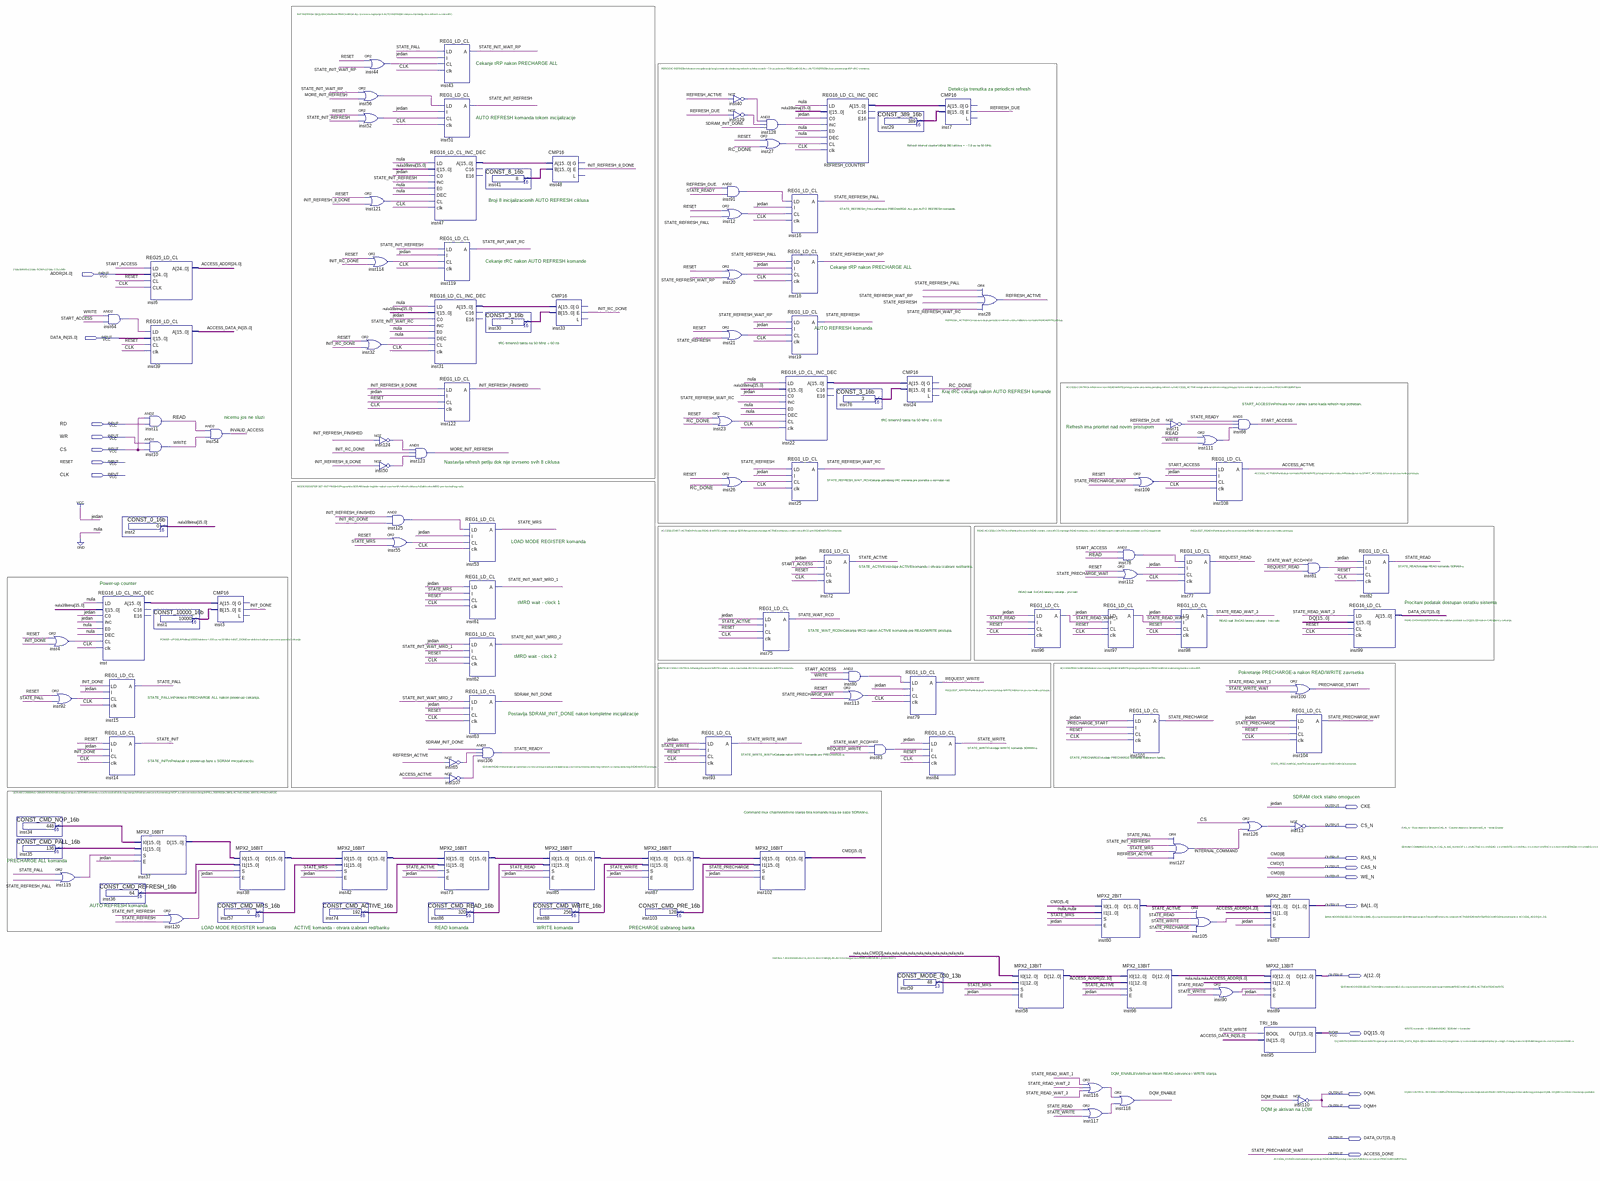
[diagram p0: schematic sheet, whole]
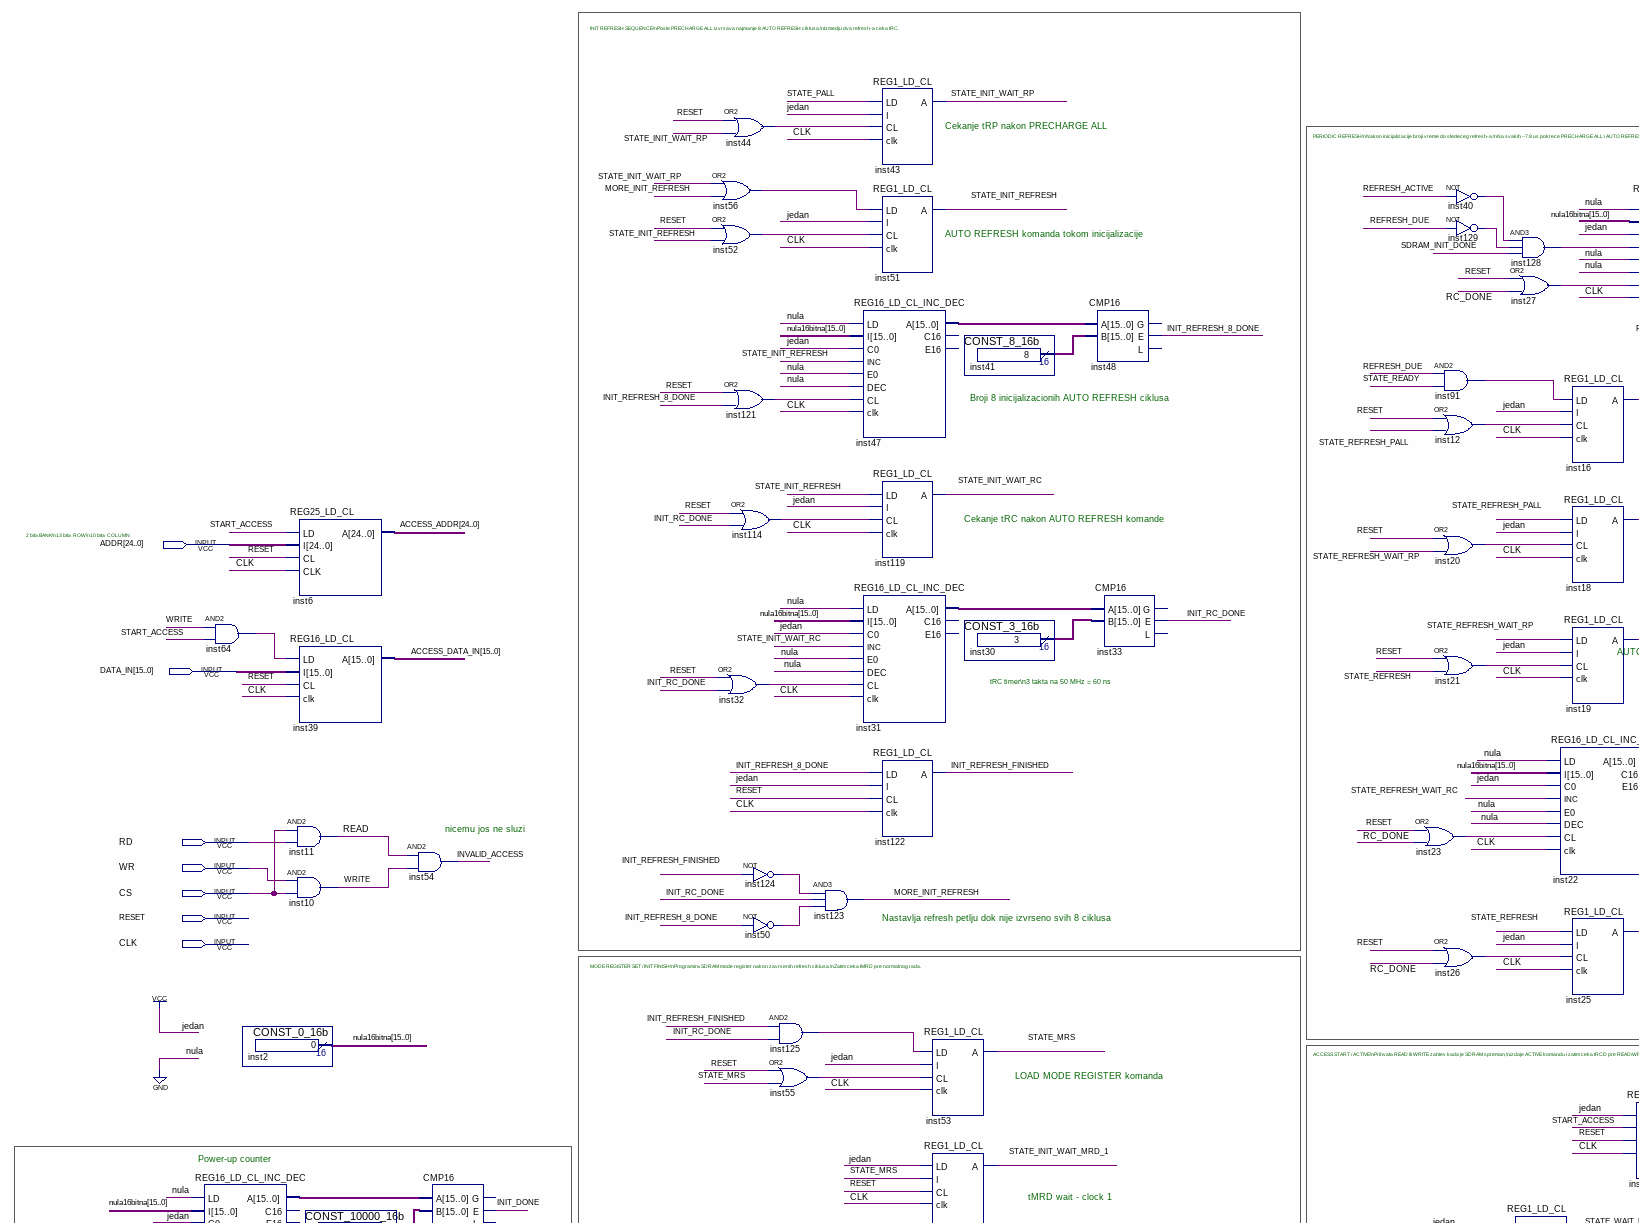
[diagram p1: schematic sheet, upper left part]
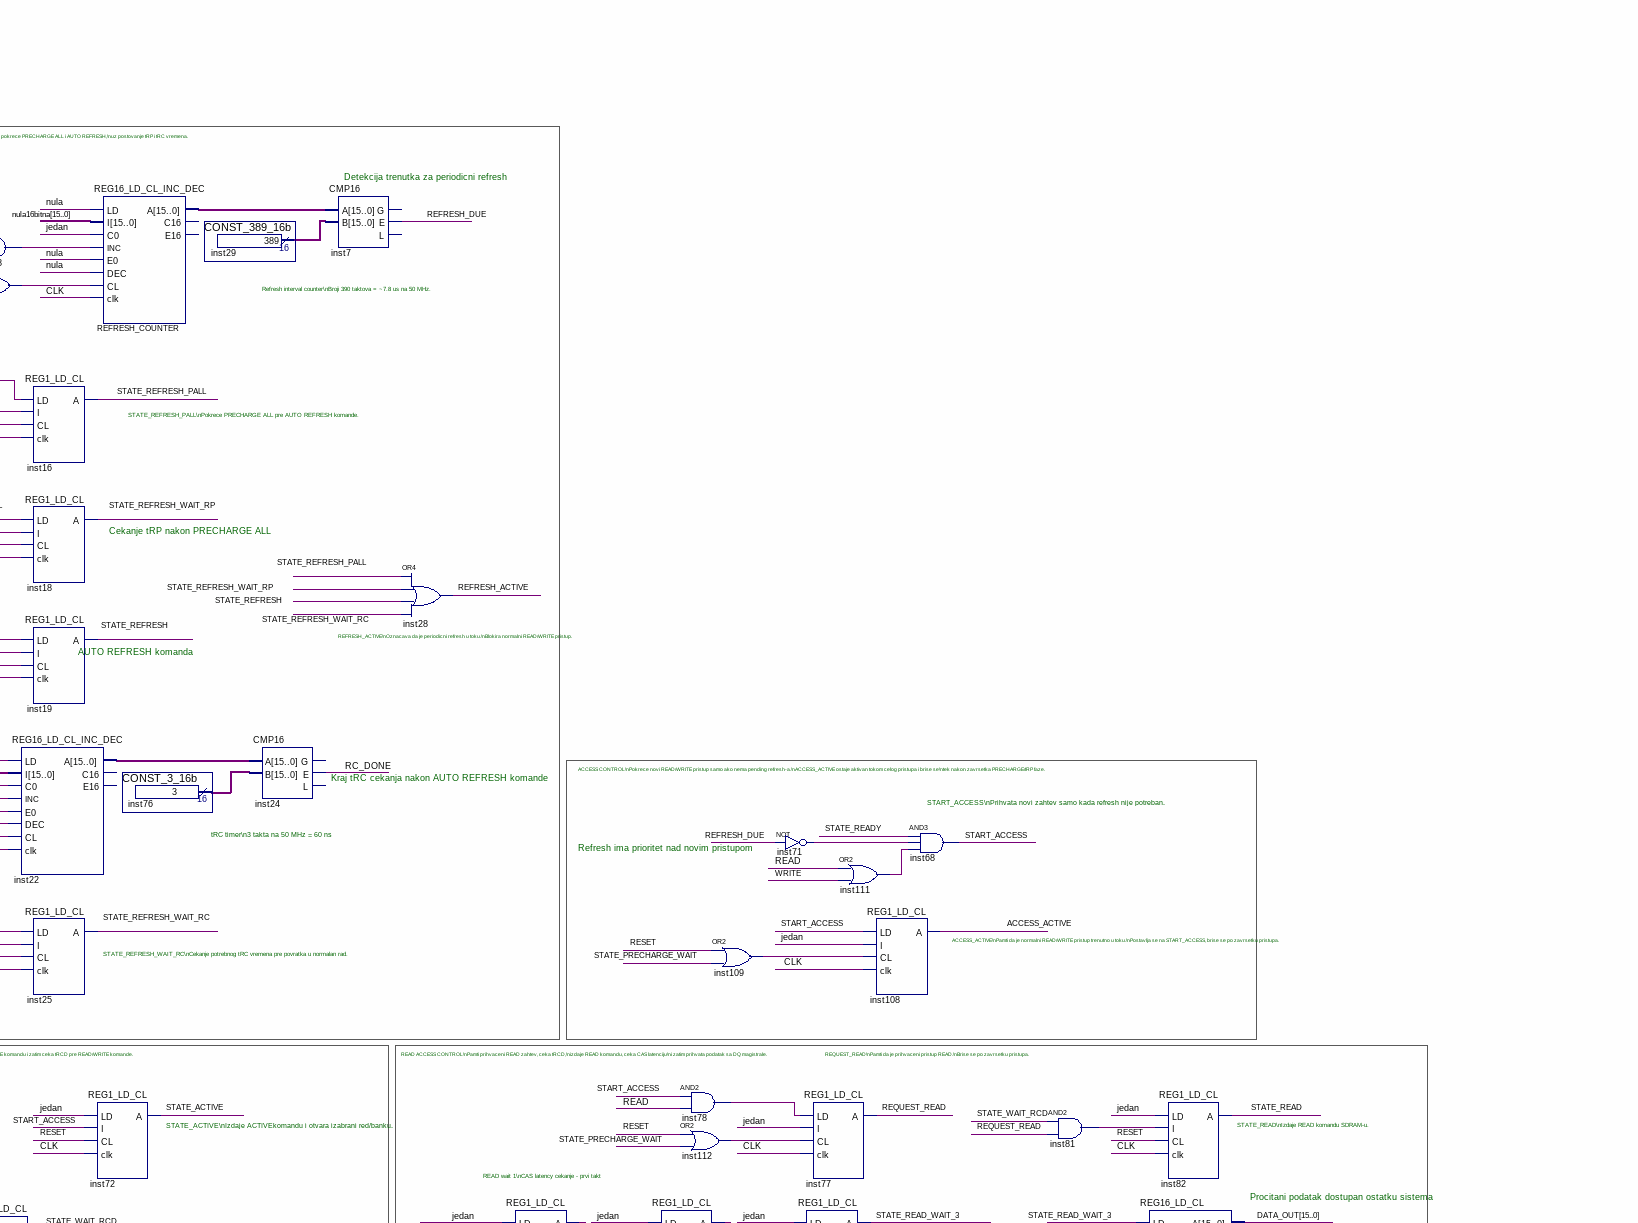
[diagram p2: schematic sheet, upper right part]
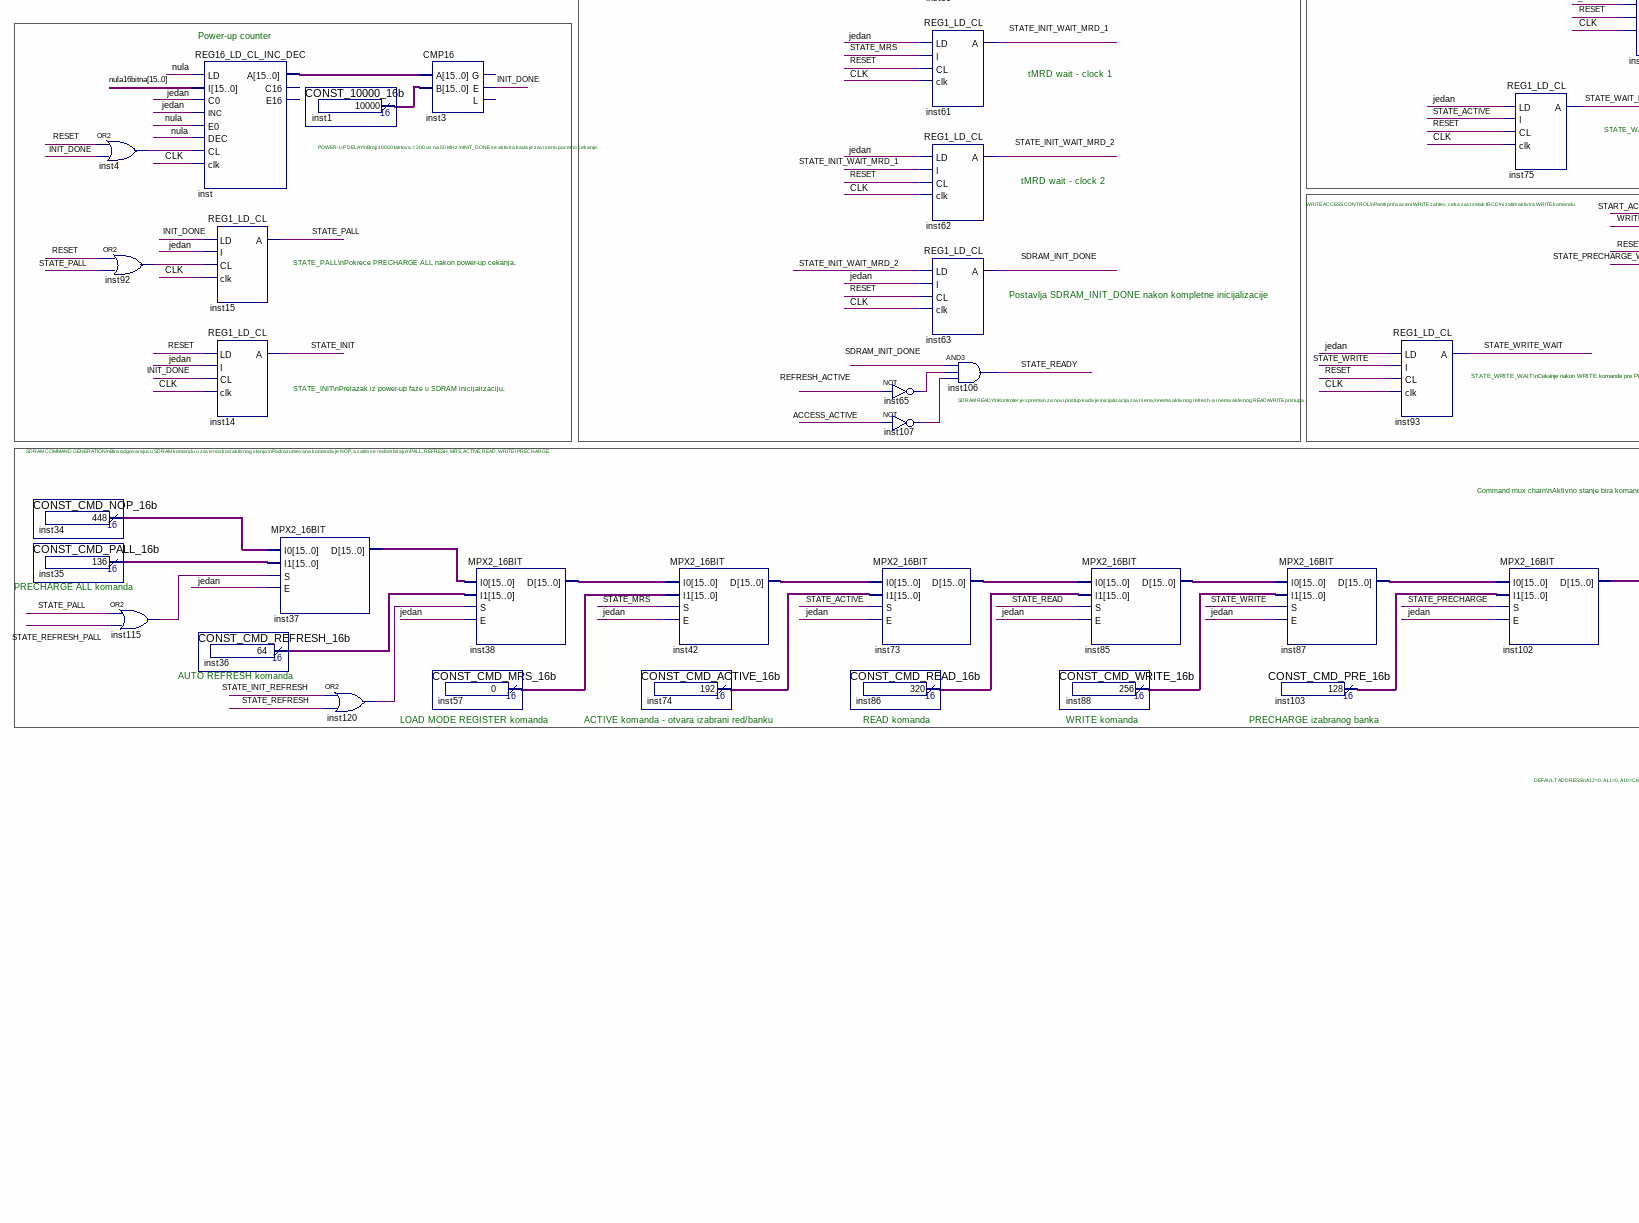
[diagram p3: schematic sheet, lower left part]
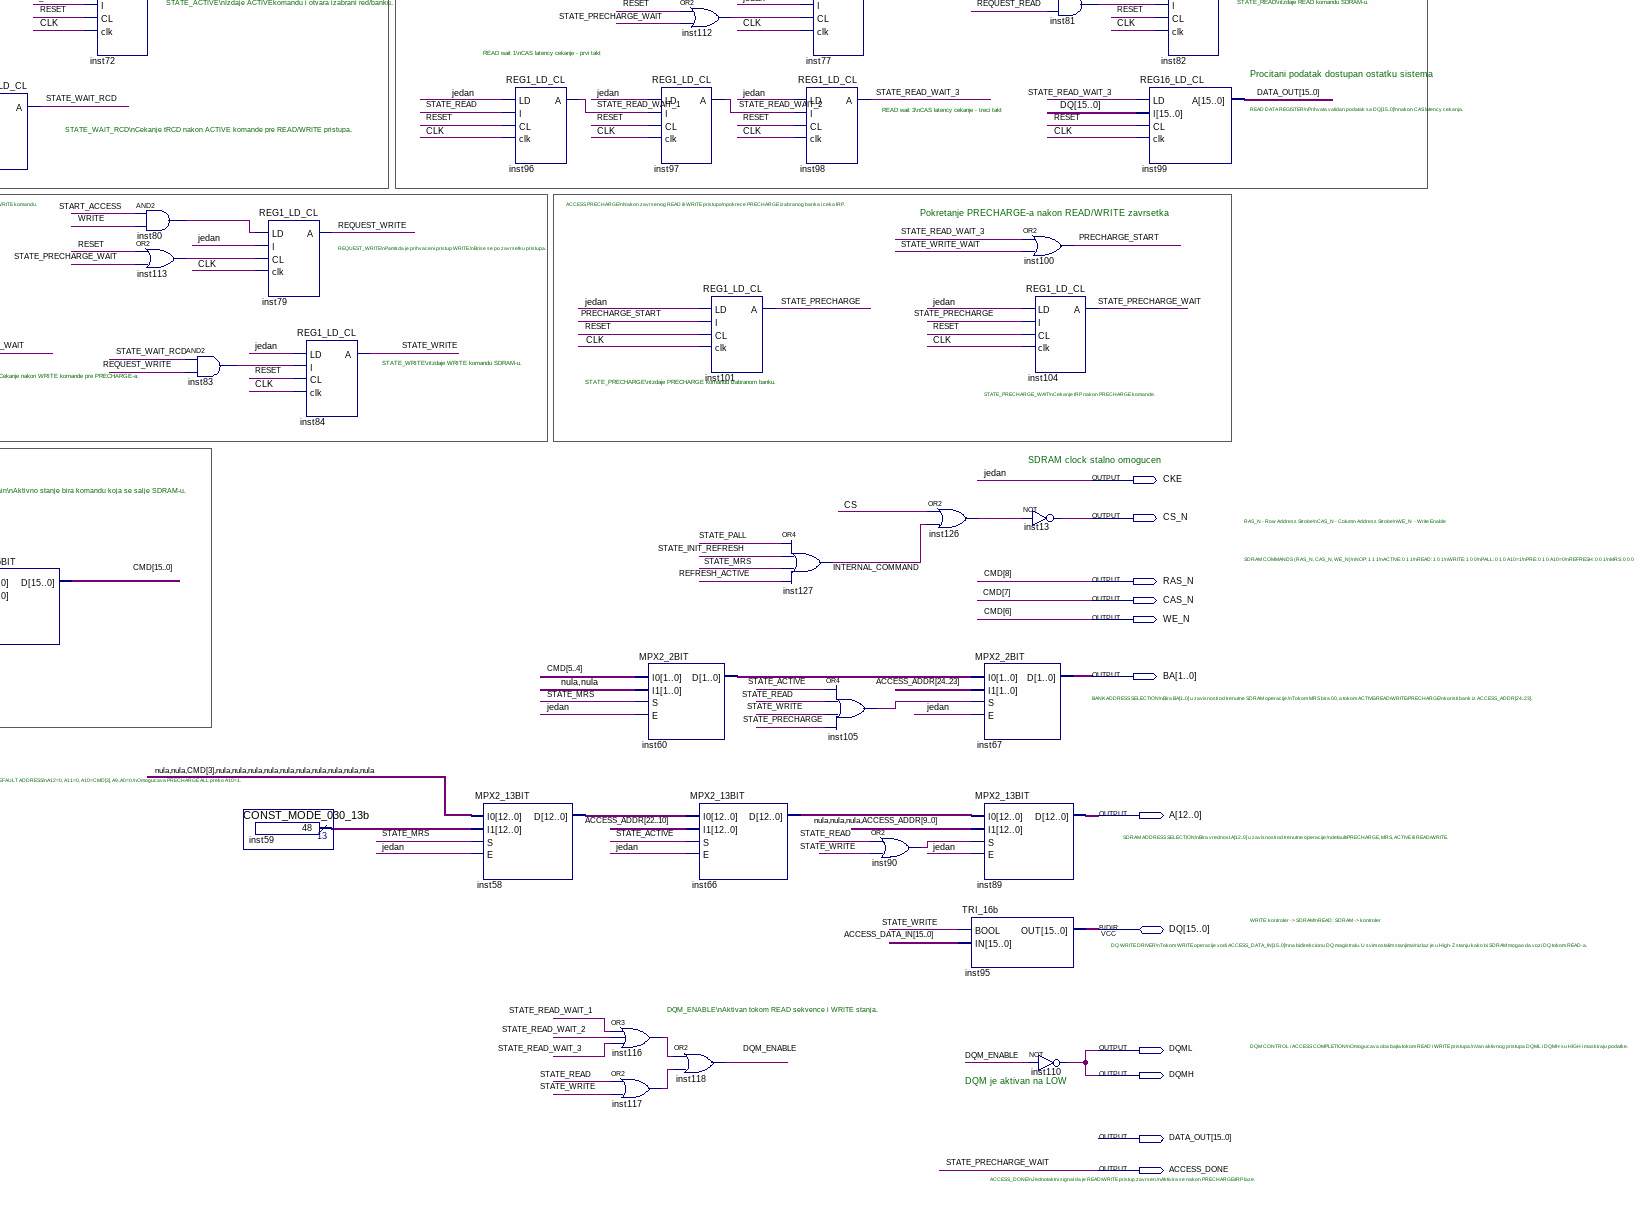
[diagram p4: schematic sheet, lower right part]
// Quartus schematic sdram_controller.bdf as structural Verilog: 121 symbols, 19 pins
module sdram_controller (
  input  [24:0] ADDR,
  input  [15:0] DATA_IN,
  input  RD,
  input  WR,
  input  CS,
  input  RESET,
  input  CLK,
  inout  [15:0] DQ,
  output CKE,
  output CS_N,
  output RAS_N,
  output CAS_N,
  output WE_N,
  output [1:0] BA,
  output [12:0] A,
  output DQML,
  output DQMH,
  output [15:0] DATA_OUT,
  output ACCESS_DONE
);

  wire ACCESS_ACTIVE, DQM_ENABLE, INIT_DONE, INIT_RC_DONE, INIT_REFRESH_8_DONE, INIT_REFRESH_FINISHED,
       inst4_out, inst12_out, inst20_out, inst21_out, inst23_out, inst26_out, inst27_out, inst32_out,
       inst40_out, inst44_out, inst50_out, inst52_out, inst55_out, inst56_out, inst64_out, inst65_out,
       inst71_out, inst78_out, inst80_out, inst81_out, inst83_out, inst90_out, inst91_out, inst92_out,
       inst105_out, inst107_out, inst109_out, inst111_out, inst112_out, inst113_out, inst114_out,
       inst115_out, inst116_out, inst117_out, inst120_out, inst121_out, inst124_out, inst125_out,
       inst126_out, inst128_out, inst129_out, INTERNAL_COMMAND, INVALID_ACCESS, MORE_INIT_REFRESH,
       PRECHARGE_START, RC_DONE, READ, REFRESH_ACTIVE, REFRESH_DUE, REQUEST_READ, REQUEST_WRITE,
       SDRAM_INIT_DONE, START_ACCESS, STATE_ACTIVE, STATE_INIT, STATE_INIT_REFRESH, STATE_INIT_WAIT_MRD_1,
       STATE_INIT_WAIT_MRD_2, STATE_INIT_WAIT_RC, STATE_INIT_WAIT_RP, STATE_MRS, STATE_PALL, STATE_PRECHARGE,
       STATE_READ, STATE_READ_WAIT_1, STATE_READ_WAIT_2, STATE_READ_WAIT_3, STATE_READY, STATE_REFRESH,
       STATE_REFRESH_PALL, STATE_REFRESH_WAIT_RC, STATE_REFRESH_WAIT_RP, STATE_WAIT_RCD, STATE_WRITE,
       STATE_WRITE_WAIT, WRITE;
  wire [1:0] inst60_d;
  wire [12:0] inst58_d, inst59_result, inst66_d;
  wire [15:0] ACCESS_DATA_IN, CMD, inst1_result, inst22_a, inst29_result, inst30_result, inst31_a,
       inst34_result, inst35_result, inst36_result, inst37_d, inst38_d, inst41_result, inst42_d, inst47_a,
       inst57_result, inst73_d, inst74_result, inst76_result, inst85_d, inst86_result, inst87_d,
       inst88_result, inst103_result, inst_a, nula16bitna, REFRESH_COUNTER_a;
  wire [24:0] ACCESS_ADDR;

  CONST_CMD_NOP_16b inst34 (.result(inst34_result));
  CONST_CMD_PALL_16b inst35 (.result(inst35_result));
  or inst4 (inst4_out, RESET, INIT_DONE);
  or inst92 (inst92_out, RESET, STATE_PALL);
  or inst115 (inst115_out, STATE_PALL, STATE_REFRESH_PALL);
  and inst64 (inst64_out, WRITE, START_ACCESS);
  REG16_LD_CL_INC_DEC inst (
    .LD(1'b0), .I(nula16bitna), .C0(1'b1), .INC(1'b1), .E0(1'b0), .DEC(1'b0), .CL(inst4_out), .clk(CLK),
    .A(inst_a));  // open: C16, E16
  REG1_LD_CL inst15 (.LD(INIT_DONE), .I(1'b1), .CL(inst92_out), .clk(CLK), .A(STATE_PALL));
  REG1_LD_CL inst14 (.LD(RESET), .I(1'b1), .CL(INIT_DONE), .clk(CLK), .A(STATE_INIT));
  CONST_CMD_REFRESH_16b inst36 (.result(inst36_result));
  CONST_0_16b inst2 (.result(nula16bitna));
  MPX2_16BIT inst37 (.I0(inst34_result), .I1(inst35_result), .S(inst115_out), .E(1'b1), .D(inst37_d));
  REG25_LD_CL inst6 (.LD(START_ACCESS), .I(ADDR), .CL(RESET), .CLK(CLK), .A(ACCESS_ADDR));
  REG16_LD_CL inst39 (.LD(inst64_out), .I(DATA_IN), .CL(RESET), .clk(CLK), .A(ACCESS_DATA_IN));
  and inst11 (READ, CS, RD);
  and inst10 (WRITE, WR, CS);
  CONST_10000_16b inst1 (.result(inst1_result));
  or inst120 (inst120_out, STATE_INIT_REFRESH, STATE_REFRESH);
  and inst54 (INVALID_ACCESS, READ, WRITE);
  CMP16 inst3 (.A(inst_a), .B(inst1_result), .E(INIT_DONE));  // open: G, L
  CONST_CMD_MRS_16b inst57 (.result(inst57_result));
  MPX2_16BIT inst38 (.I0(inst37_d), .I1(inst36_result), .S(inst120_out), .E(1'b1), .D(inst38_d));
  MPX2_16BIT inst42 (.I0(inst38_d), .I1(inst57_result), .S(STATE_MRS), .E(1'b1), .D(inst42_d));
  CONST_CMD_ACTIVE_16b inst74 (.result(inst74_result));
  or inst44 (inst44_out, RESET, STATE_INIT_WAIT_RP);
  or inst56 (inst56_out, STATE_INIT_WAIT_RP, MORE_INIT_REFRESH);
  or inst52 (inst52_out, RESET, STATE_INIT_REFRESH);
  or inst121 (inst121_out, RESET, INIT_REFRESH_8_DONE);
  or inst114 (inst114_out, RESET, INIT_RC_DONE);
  or inst32 (inst32_out, RESET, INIT_RC_DONE);
  not inst124 (inst124_out, INIT_REFRESH_FINISHED);
  not inst50 (inst50_out, INIT_REFRESH_8_DONE);
  and inst125 (inst125_out, INIT_REFRESH_FINISHED, INIT_RC_DONE);
  or inst55 (inst55_out, RESET, STATE_MRS);
  and inst123 (MORE_INIT_REFRESH, inst124_out, INIT_RC_DONE, inst50_out);
  REG1_LD_CL inst43 (.LD(STATE_PALL), .I(1'b1), .CL(inst44_out), .clk(CLK), .A(STATE_INIT_WAIT_RP));
  REG1_LD_CL inst51 (.LD(inst56_out), .I(1'b1), .CL(inst52_out), .clk(CLK), .A(STATE_INIT_REFRESH));
  REG16_LD_CL_INC_DEC inst47 (
    .LD(1'b0), .I(nula16bitna), .C0(1'b1), .INC(STATE_INIT_REFRESH), .E0(1'b0), .DEC(1'b0), .CL(inst121_out),
    .clk(CLK), .A(inst47_a));  // open: C16, E16
  REG1_LD_CL inst119 (.LD(STATE_INIT_REFRESH), .I(1'b1), .CL(inst114_out), .clk(CLK), .A(STATE_INIT_WAIT_RC));
  REG16_LD_CL_INC_DEC inst31 (
    .LD(1'b0), .I(nula16bitna), .C0(1'b1), .INC(STATE_INIT_WAIT_RC), .E0(1'b0), .DEC(1'b0), .CL(inst32_out),
    .clk(CLK), .A(inst31_a));  // open: C16, E16
  REG1_LD_CL inst122 (.LD(INIT_REFRESH_8_DONE), .I(1'b1), .CL(RESET), .clk(CLK), .A(INIT_REFRESH_FINISHED));
  not inst65 (inst65_out, REFRESH_ACTIVE);
  not inst107 (inst107_out, ACCESS_ACTIVE);
  MPX2_16BIT inst73 (.I0(inst42_d), .I1(inst74_result), .S(STATE_ACTIVE), .E(1'b1), .D(inst73_d));
  CONST_CMD_READ_16b inst86 (.result(inst86_result));
  REG1_LD_CL inst53 (.LD(inst125_out), .I(1'b1), .CL(inst55_out), .clk(CLK), .A(STATE_MRS));
  REG1_LD_CL inst61 (.LD(1'b1), .I(STATE_MRS), .CL(RESET), .clk(CLK), .A(STATE_INIT_WAIT_MRD_1));
  REG1_LD_CL inst62 (.LD(1'b1), .I(STATE_INIT_WAIT_MRD_1), .CL(RESET), .clk(CLK), .A(STATE_INIT_WAIT_MRD_2));
  REG1_LD_CL inst63 (.LD(STATE_INIT_WAIT_MRD_2), .I(1'b1), .CL(RESET), .clk(CLK), .A(SDRAM_INIT_DONE));
  CONST_8_16b inst41 (.result(inst41_result));
  CONST_3_16b inst30 (.result(inst30_result));
  and inst106 (STATE_READY, SDRAM_INIT_DONE, inst65_out, inst107_out);
  CMP16 inst48 (.A(inst47_a), .B(inst41_result), .E(INIT_REFRESH_8_DONE));  // open: G, L
  CMP16 inst33 (.A(inst31_a), .B(inst30_result), .E(INIT_RC_DONE));  // open: G, L
  MPX2_16BIT inst85 (.I0(inst73_d), .I1(inst86_result), .S(STATE_READ), .E(1'b1), .D(inst85_d));
  CONST_CMD_WRITE_16b inst88 (.result(inst88_result));
  MPX2_16BIT inst87 (.I0(inst85_d), .I1(inst88_result), .S(STATE_WRITE), .E(1'b1), .D(inst87_d));
  CONST_CMD_PRE_16b inst103 (.result(inst103_result));
  REG1_LD_CL inst93 (.LD(1'b1), .I(STATE_WRITE), .CL(RESET), .clk(CLK), .A(STATE_WRITE_WAIT));
  not inst40 (inst40_out, REFRESH_ACTIVE);
  not inst129 (inst129_out, REFRESH_DUE);
  and inst91 (inst91_out, REFRESH_DUE, STATE_READY);
  or inst12 (inst12_out, RESET, STATE_REFRESH_PALL);
  or inst20 (inst20_out, RESET, STATE_REFRESH_WAIT_RP);
  or inst21 (inst21_out, RESET, STATE_REFRESH);
  or inst23 (inst23_out, RESET, RC_DONE);
  or inst26 (inst26_out, RESET, RC_DONE);
  MPX2_16BIT inst102 (
    .I0(inst87_d), .I1(inst103_result), .S(STATE_PRECHARGE), .E(1'b1),
    .D({CMD[15:9], RAS_N, CAS_N, WE_N, CMD[5:0]}));
  and inst128 (inst128_out, inst40_out, inst129_out, SDRAM_INIT_DONE);
  or inst27 (inst27_out, RESET, RC_DONE);
  REG16_LD_CL_INC_DEC inst22 (
    .LD(1'b0), .I(nula16bitna), .C0(1'b1), .INC(STATE_REFRESH_WAIT_RC), .E0(1'b0), .DEC(1'b0),
    .CL(inst23_out), .clk(CLK), .A(inst22_a));  // open: C16, E16
  REG1_LD_CL inst75 (.LD(1'b1), .I(STATE_ACTIVE), .CL(RESET), .clk(CLK), .A(STATE_WAIT_RCD));
  REG1_LD_CL inst16 (.LD(inst91_out), .I(1'b1), .CL(inst12_out), .clk(CLK), .A(STATE_REFRESH_PALL));
  REG1_LD_CL inst18 (.LD(STATE_REFRESH_PALL), .I(1'b1), .CL(inst20_out), .clk(CLK), .A(STATE_REFRESH_WAIT_RP));
  REG1_LD_CL inst19 (.LD(STATE_REFRESH_WAIT_RP), .I(1'b1), .CL(inst21_out), .clk(CLK), .A(STATE_REFRESH));
  REG1_LD_CL inst25 (.LD(STATE_REFRESH), .I(1'b1), .CL(inst26_out), .clk(CLK), .A(STATE_REFRESH_WAIT_RC));
  REG16_LD_CL_INC_DEC REFRESH_COUNTER (
    .LD(1'b0), .I(nula16bitna), .C0(1'b1), .INC(inst128_out), .E0(1'b0), .DEC(1'b0), .CL(inst27_out),
    .clk(CLK), .A(REFRESH_COUNTER_a));  // open: C16, E16
  REG1_LD_CL inst72 (.LD(1'b1), .I(START_ACCESS), .CL(RESET), .clk(CLK), .A(STATE_ACTIVE));
  CONST_3_16b inst76 (.result(inst76_result));
  and inst80 (inst80_out, START_ACCESS, WRITE);
  or inst113 (inst113_out, RESET, ACCESS_DONE);
  CONST_389_16b inst29 (.result(inst29_result));
  and inst83 (inst83_out, STATE_WAIT_RCD, REQUEST_WRITE);
  CMP16 inst24 (.A(inst22_a), .B(inst76_result), .E(RC_DONE));  // open: G, L
  REG1_LD_CL inst79 (.LD(inst80_out), .I(1'b1), .CL(inst113_out), .clk(CLK), .A(REQUEST_WRITE));
  CONST_MODE_030_13b inst59 (.result(inst59_result));
  REG1_LD_CL inst84 (.LD(1'b1), .I(inst83_out), .CL(RESET), .clk(CLK), .A(STATE_WRITE));
  CMP16 inst7 (.A(REFRESH_COUNTER_a), .B(inst29_result), .E(REFRESH_DUE));  // open: G, L
  or inst28 (REFRESH_ACTIVE, STATE_REFRESH_PALL, STATE_REFRESH_WAIT_RP, STATE_REFRESH, STATE_REFRESH_WAIT_RC);
  REG1_LD_CL inst96 (.LD(1'b1), .I(STATE_READ), .CL(RESET), .clk(CLK), .A(STATE_READ_WAIT_1));
  MPX2_13BIT inst58 (.I0({2'b00, CMD[3], {10{1'b0}}}), .I1(inst59_result), .S(STATE_MRS), .E(1'b1), .D(inst58_d));
  or inst116 (inst116_out, STATE_READ_WAIT_1, STATE_READ_WAIT_2, STATE_READ_WAIT_3);
  or inst117 (inst117_out, STATE_READ, STATE_WRITE);
  REG1_LD_CL inst97 (.LD(1'b1), .I(STATE_READ_WAIT_1), .CL(RESET), .clk(CLK), .A(STATE_READ_WAIT_2));
  MPX2_2BIT inst60 (.I0(CMD[5:4]), .I1(2'b00), .S(STATE_MRS), .E(1'b1), .D(inst60_d));
  or inst109 (inst109_out, RESET, ACCESS_DONE);
  and inst78 (inst78_out, START_ACCESS, READ);
  or inst112 (inst112_out, RESET, ACCESS_DONE);
  REG1_LD_CL inst101 (.LD(1'b1), .I(PRECHARGE_START), .CL(RESET), .clk(CLK), .A(STATE_PRECHARGE));
  MPX2_13BIT inst66 (.I0(inst58_d), .I1(ACCESS_ADDR[22:10]), .S(STATE_ACTIVE), .E(1'b1), .D(inst66_d));
  or inst118 (DQM_ENABLE, inst116_out, inst117_out);
  not inst71 (inst71_out, REFRESH_DUE);
  REG1_LD_CL inst77 (.LD(inst78_out), .I(1'b1), .CL(inst112_out), .clk(CLK), .A(REQUEST_READ));
  REG1_LD_CL inst98 (.LD(1'b1), .I(STATE_READ_WAIT_2), .CL(RESET), .clk(CLK), .A(STATE_READ_WAIT_3));
  or inst127 (INTERNAL_COMMAND, STATE_PALL, STATE_INIT_REFRESH, STATE_MRS, REFRESH_ACTIVE);
  or inst111 (inst111_out, READ, WRITE);
  REG1_LD_CL inst108 (.LD(START_ACCESS), .I(1'b1), .CL(inst109_out), .clk(CLK), .A(ACCESS_ACTIVE));
  or inst105 (inst105_out, STATE_ACTIVE, STATE_READ, STATE_WRITE, STATE_PRECHARGE);
  or inst90 (inst90_out, STATE_READ, STATE_WRITE);
  and inst68 (START_ACCESS, STATE_READY, inst71_out, inst111_out);
  or inst126 (inst126_out, CS, INTERNAL_COMMAND);
  MPX2_2BIT inst67 (.I0(inst60_d), .I1(ACCESS_ADDR[24:23]), .S(inst105_out), .E(1'b1), .D(BA));
  MPX2_13BIT inst89 (.I0(inst66_d), .I1({3'b000, ACCESS_ADDR[9:0]}), .S(inst90_out), .E(1'b1), .D(A));
  TRI_16b inst95 (.BOOL(STATE_WRITE), .IN(ACCESS_DATA_IN), .OUT(DQ));
  or inst100 (PRECHARGE_START, STATE_READ_WAIT_3, STATE_WRITE_WAIT);
  REG1_LD_CL inst104 (.LD(1'b1), .I(STATE_PRECHARGE), .CL(RESET), .clk(CLK), .A(ACCESS_DONE));
  not inst13 (CS_N, inst126_out);
  and inst81 (inst81_out, STATE_WAIT_RCD, REQUEST_READ);
  not inst110 (DQMH, DQM_ENABLE);
  REG1_LD_CL inst82 (.LD(1'b1), .I(inst81_out), .CL(RESET), .clk(CLK), .A(STATE_READ));
  REG16_LD_CL inst99 (.LD(STATE_READ_WAIT_3), .I(DQ), .CL(RESET), .clk(CLK), .A(DATA_OUT));

  assign CKE = 1'b1;
  assign DQML = DQMH;

  // Other names for the same wires on the sheet: CMD[8:6] = {RAS_N, CAS_N, WE_N}; STATE_PRECHARGE_WAIT = ACCESS_DONE

  // Notes on the sheet:
  //   INIT REFRESH SEQUENCE\nPosle PRECHARGE ALL izvrsava najmanje 8 AUTO REFRESH ciklusa.\nIzmedju dva refresh-a ceka tRC.
  //   Cekanje tRP nakon PRECHARGE ALL
  //   PERIODIC REFRESH\nNakon inicijalizacije broji vreme do sledeceg refresh-a.\nNa svakih ~7.8 us pokrece PRECHARGE ALL i AUTO REFRESH,\nuz postovanje tRP i tRC vremena.
  //   Detekcija trenutka za periodicni refresh
  //   AUTO REFRESH komanda tokom inicijalizacije
  //   Refresh interval counter\nBroji 390 taktova = ~7.8 us na 50 MHz.
  //   Broji 8 inicijalizacionih AUTO REFRESH ciklusa
  //   STATE_REFRESH_PALL\nPokrece PRECHARGE ALL pre AUTO REFRESH komande.
  //   Cekanje tRC nakon AUTO REFRESH komande
  //   Cekanje tRP nakon PRECHARGE ALL
  //   2 bita BANK\n13 bita  ROW\n10 bita  COLUMN
  //   REFRESH_ACTIVE\nOznacava da je periodicni refresh u toku.\nBlokira normalni READ/WRITE pristup.
  //   AUTO REFRESH komanda
  //   tRC timer\n3 takta na 50 MHz = 60 ns
  //   ACCESS CONTROL\nPokrece novi READ/WRITE pristup samo ako nema pending refresh-a.\nACCESS_ACTIVE ostaje aktivan tokom celog pristupa i brise se\ntek nakon zavrsetka PRECHARGE/tRP faze.
  //   Kraj tRC cekanja nakon AUTO REFRESH komande
  //   START_ACCESS\nPrihvata novi zahtev samo kada refresh nije potreban.
  //   nicemu jos ne sluzi
  //   tRC timer\n3 takta na 50 MHz = 60 ns
  //   Refresh ima prioritet nad novim pristupom
  //   Nastavlja refresh petlju dok nije izvrseno svih 8 ciklusa
  //   ACCESS_ACTIVE\nPamti da je normalni READ/WRITE pristup trenutno u toku.\nPostavlja se na START_ACCESS, brise se po zavrsetku pristupa.
  //   STATE_REFRESH_WAIT_RC\nCekanje potrebnog tRC vremena pre povratka u normalan rad.
  //   MODE REGISTER SET / INIT FINISH\nProgramira SDRAM mode register nakon zavrsenih refresh ciklusa.\nZatim ceka tMRD pre normalnog rada.
  //   ACCESS START / ACTIVE\nPrihvata READ ili WRITE zahtev kada je SDRAM spreman,\nizdaje ACTIVE komandu i zatim ceka tRCD pre READ/WRITE komande.
  //   READ ACCESS CONTROL\nPamti prihvaceni READ zahtev, ceka tRCD,\nizdaje READ komandu, ceka CAS latenciju\ni zatim prihvata podatak sa DQ magistrale.
  //   REQUEST_READ\nPamti da je prihvaceni pristup READ.\nBrise se po zavrsetku pristupa.
  //   LOAD MODE REGISTER komanda
  //   STATE_ACTIVE\nIzdaje ACTIVEkomandu i otvara izabrani red/banku.
  //   STATE_READ\nIzdaje READ komandu SDRAM-u.
  //   Power-up counter
  //   READ wait 1\nCAS latency cekanje - prvi takt
  //   tMRD wait - clock 1
  //   Procitani podatak dostupan ostatku sistema
  //   READ wait 3\nCAS latency cekanje - treci takt
  //   READ DATA REGISTER\nPrihvata validan podatak sa DQ[15..0]\nnakon CAS latency cekanja.
  //   STATE_WAIT_RCD\nCekanje tRCD nakon ACTIVE komande pre READ/WRITE pristupa.
  //   POWER-UP DELAY\nBroji 10000 taktova = 200 us na 50 MHz.\nINIT_DONE se aktivira kada je zavrseno pocetno cekanje.
  //   tMRD wait - clock 2
  //   WRITE ACCESS CONTROL\nPamti prihvaceni WRITE zahtev, ceka zavrsetak tRCD\ni zatim aktivira WRITE komandu.
  //   ACCESS PRECHARGE\nNakon zavrsenog READ ili WRITE pristupa\npokrece PRECHARGE izabranog banka i ceka tRP.
  //   Pokretanje PRECHARGE-a nakon READ/WRITE zavrsetka
  //   REQUEST_WRITE\nPamti da je prihvaceni pristup WRITE.\nBrise se po zavrsetku pristupa.
  //   STATE_PALL\nPokrece PRECHARGE ALL nakon power-up cekanja.
  //   Postavlja SDRAM_INIT_DONE nakon kompletne inicijalizacije
  //   STATE_WRITE\nIzdaje WRITE komandu SDRAM-u.
  //   STATE_WRITE_WAIT\nCekanje nakon WRITE komande pre PRECHARGE-a.
  //   STATE_PRECHARGE\nIzdaje PRECHARGE komandu izabranom banku.
  //   STATE_INIT\nPrelazak iz power-up faze u SDRAM inicijalizaciju.
  //   STATE_PRECHARGE_WAIT\nCekanje tRP nakon PRECHARGE komande.
  //   SDRAM READY\nKontroler je spreman za novi pristup kada je inicijalizacija zavrsena,\nnema aktivnog refresh-a i nema aktivnog READ/WRITE pristupa.
  //   SDRAM COMMAND GENERATION\nBira odgovarajucu SDRAM komandu u zavisnosti od aktivnog stanja.\nPodrazumevana komanda je NOP, a zatim se redom biraju\nPALL, REFRESH, MRS, ACTIVE, READ, WRITE i PRECHARGE.
  //   SDRAM clock stalno omogucen
  //   Command mux chain\nAktivno stanje bira komandu koja se salje SDRAM-u.
  //   RAS_N - Row Address Strobe\nCAS_N - Column Address Strobe\nWE_N  - Write Enable
  //   SDRAM COMMANDS (RAS_N, CAS_N, WE_N)\nNOP: 1 1 1\nACTIVE: 0 1 1\nREAD: 1 0 1\nWRITE: 1 0 0\nPALL: 0 1 0 A10=1\nPRE: 0 1 0 A10=0\nREFRESH: 0 0 1\nMRS: 0 0 0
  //   PRECHARGE ALL komanda
  //   AUTO REFRESH komanda
  //   BANK ADDRESS SELECTION\nBira BA[1..0] u zavisnosti od trenutne SDRAM operacije.\nTokom MRS bira 00, a tokom ACTIVE/READ/WRITE/PRECHARGE\nkoristi bank iz ACCESS_ADDR[24..23].
  //   LOAD MODE REGISTER komanda
  //   ACTIVE komanda - otvara izabrani red/banku
  //   READ komanda
  //   WRITE komanda
  //   PRECHARGE izabranog banka
  //   DEFAULT ADDRESS\nA12=0, A11=0, A10=CMD[3], A9..A0=0.\nOmogucava PRECHARGE ALL preko A10=1.
  //   SDRAM ADDRESS SELECTION\nBira vrednost A[12..0] u zavisnosti od trenutne operacije:\ndefault/PRECHARGE, MRS, ACTIVE ili READ/WRITE.
  //   WRITE: kontroler -> SDRAM\nREAD:  SDRAM -> kontroler
  //   DQ WRITE DRIVER\nTokom WRITE operacije vodi ACCESS_DATA_IN[15..0]\nna bidirekcionu DQ magistralu. U svim ostalim stanjima\nizlaz je u High-Z stanju kako bi SDRAM mogao da vozi DQ tokom READ-a.
  //   DQM_ENABLE\nAktivan tokom READ sekvence i WRITE stanja.
  //   DQM CONTROL / ACCESS COMPLETION\nOmogucava oba bajta tokom READ i WRITE pristupa.\nVan aktivnog pristupa DQML i DQMH su HIGH i maskiraju podatke.
  //   DQM je aktivan na LOW
  //   ACCESS_DONE\nJednotaktni signal da je READ/WRITE pristup zavrsen.\nAktivira se nakon PRECHARGE/tRP faze.
endmodule
